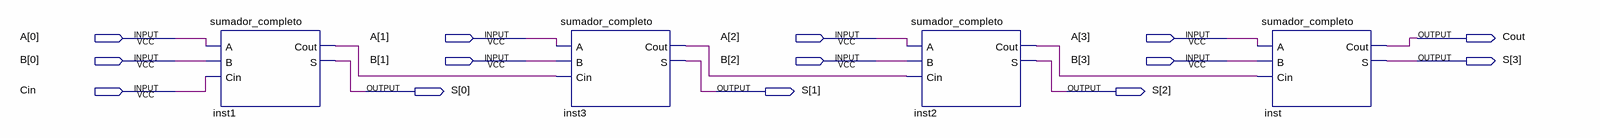
[diagram p0: schematic sheet]
// Quartus schematic sumador4_bdf.bdf as structural Verilog: 4 symbols, 14 pins
module sumador4_bdf (
  input  [3:0] A,
  input  [3:0] B,
  input  Cin,
  output Cout,
  output [3:0] S
);

  wire inst1_cout, inst2_cout, inst3_cout;

  sumador_completo inst1 (.A(A[0]), .B(B[0]), .Cin(Cin), .Cout(inst1_cout), .S(S[0]));
  sumador_completo inst3 (.A(A[1]), .B(B[1]), .Cin(inst1_cout), .Cout(inst3_cout), .S(S[1]));
  sumador_completo inst2 (.A(A[2]), .B(B[2]), .Cin(inst3_cout), .Cout(inst2_cout), .S(S[2]));
  sumador_completo inst (.A(A[3]), .B(B[3]), .Cin(inst2_cout), .Cout(Cout), .S(S[3]));
endmodule
